# Altium schematic sheet PCB-MAIN_03_AUDIO.SchDoc
size 594 x 420 mm
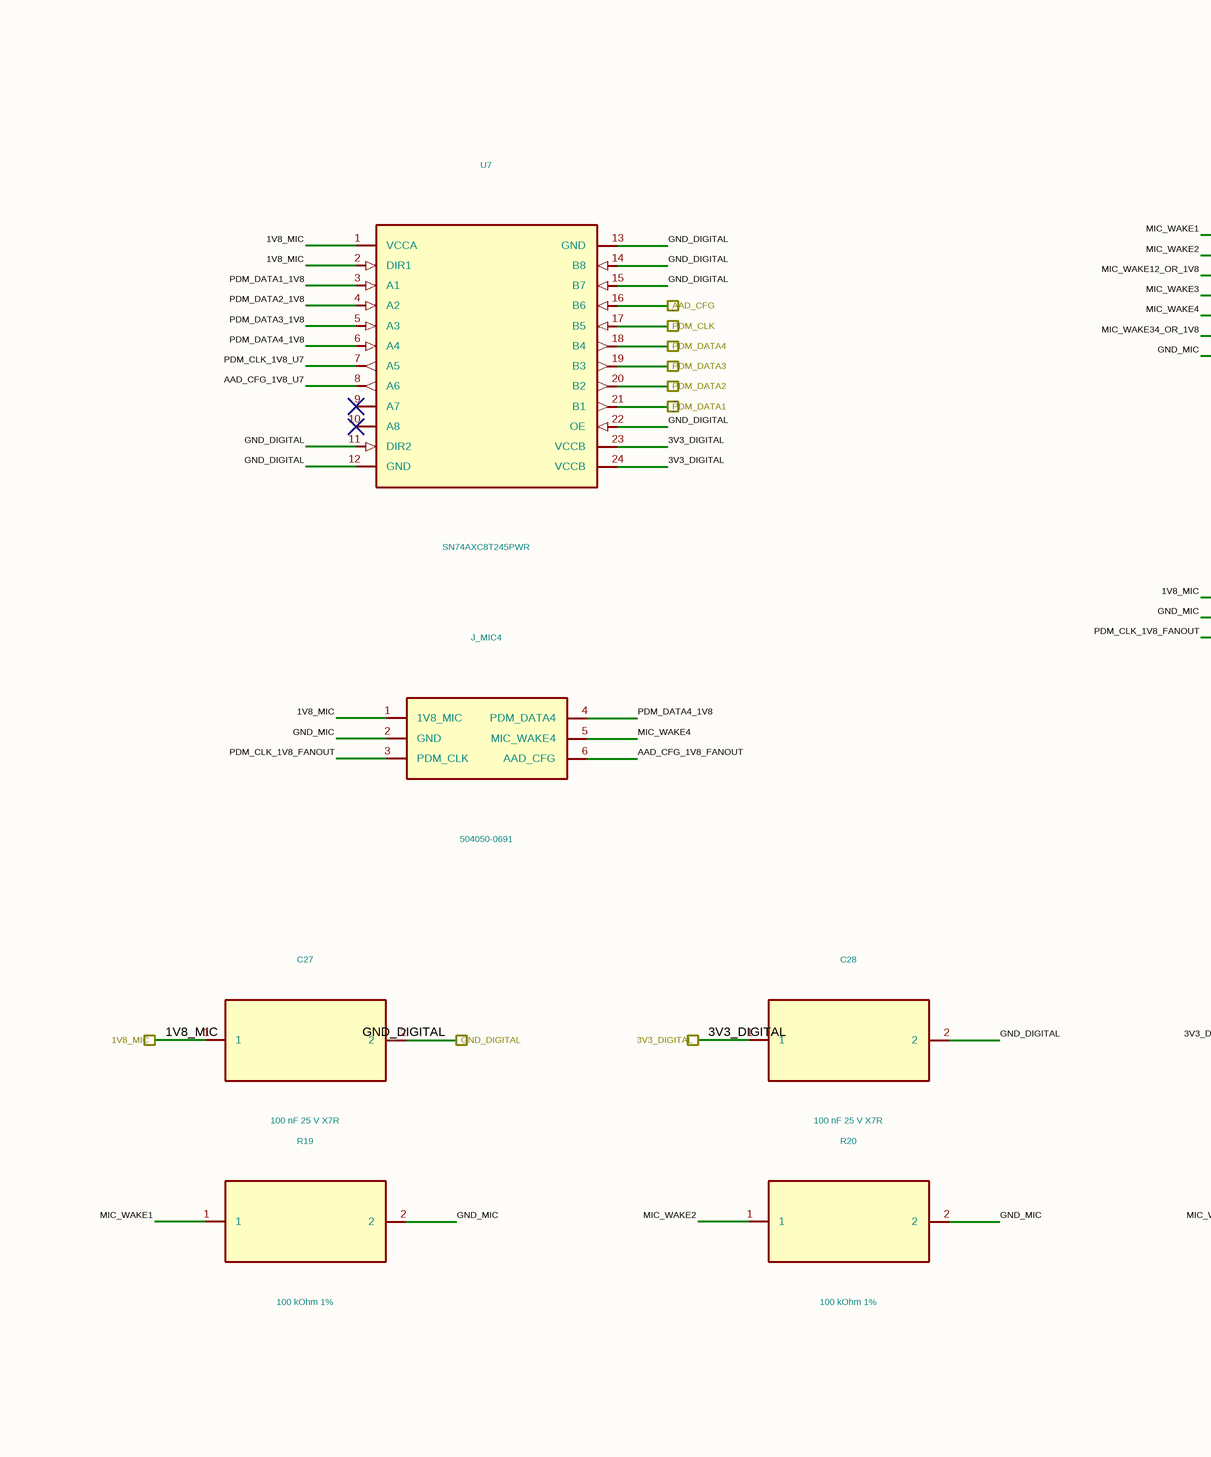
[diagram p0: PCB-MAIN_03_AUDIO.SchDoc, top left]
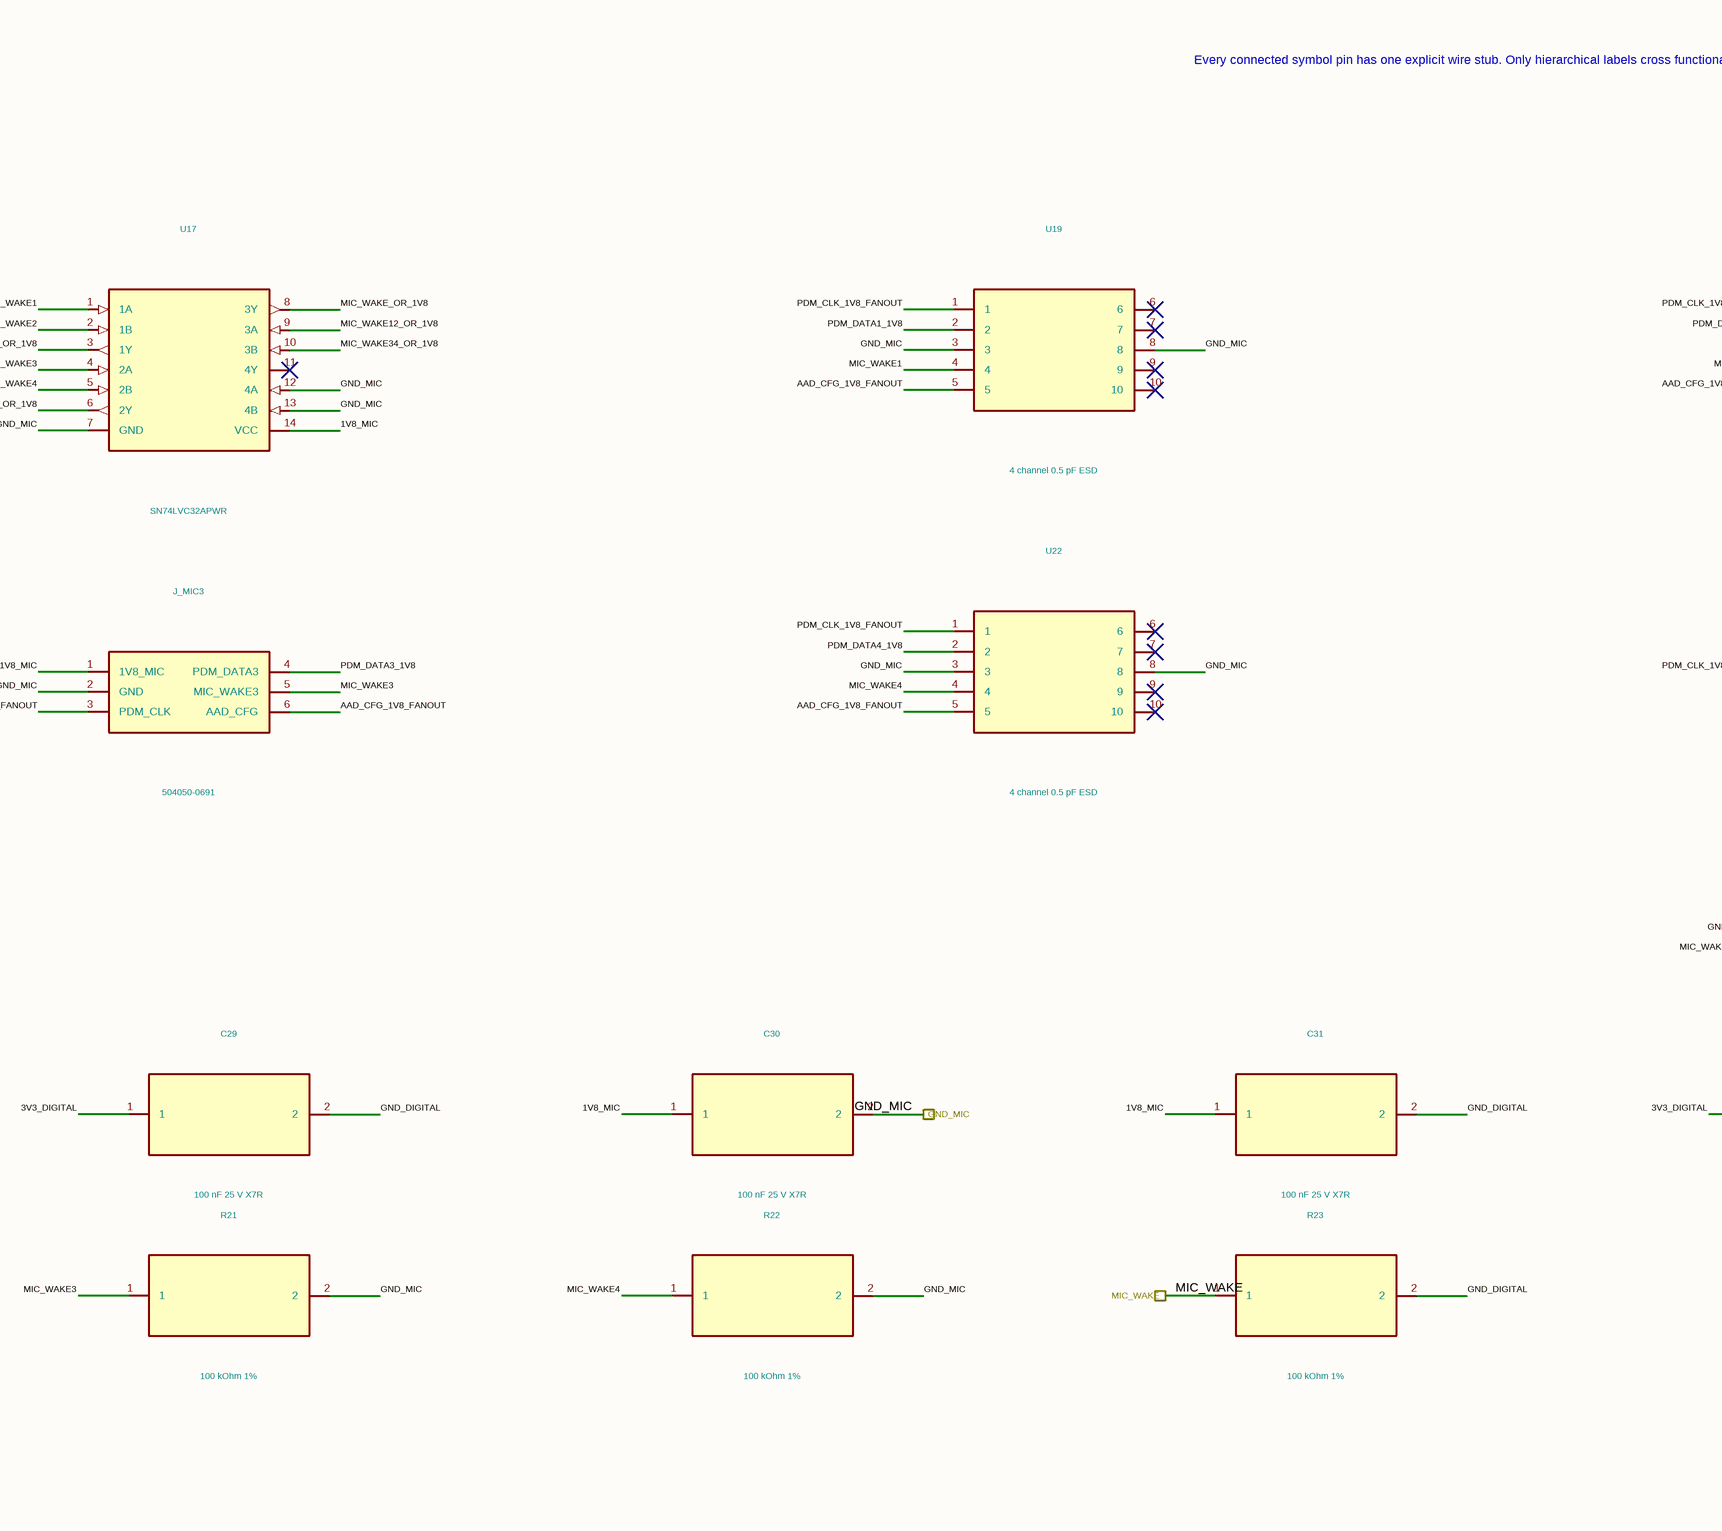
[diagram p1: PCB-MAIN_03_AUDIO.SchDoc, top middle]
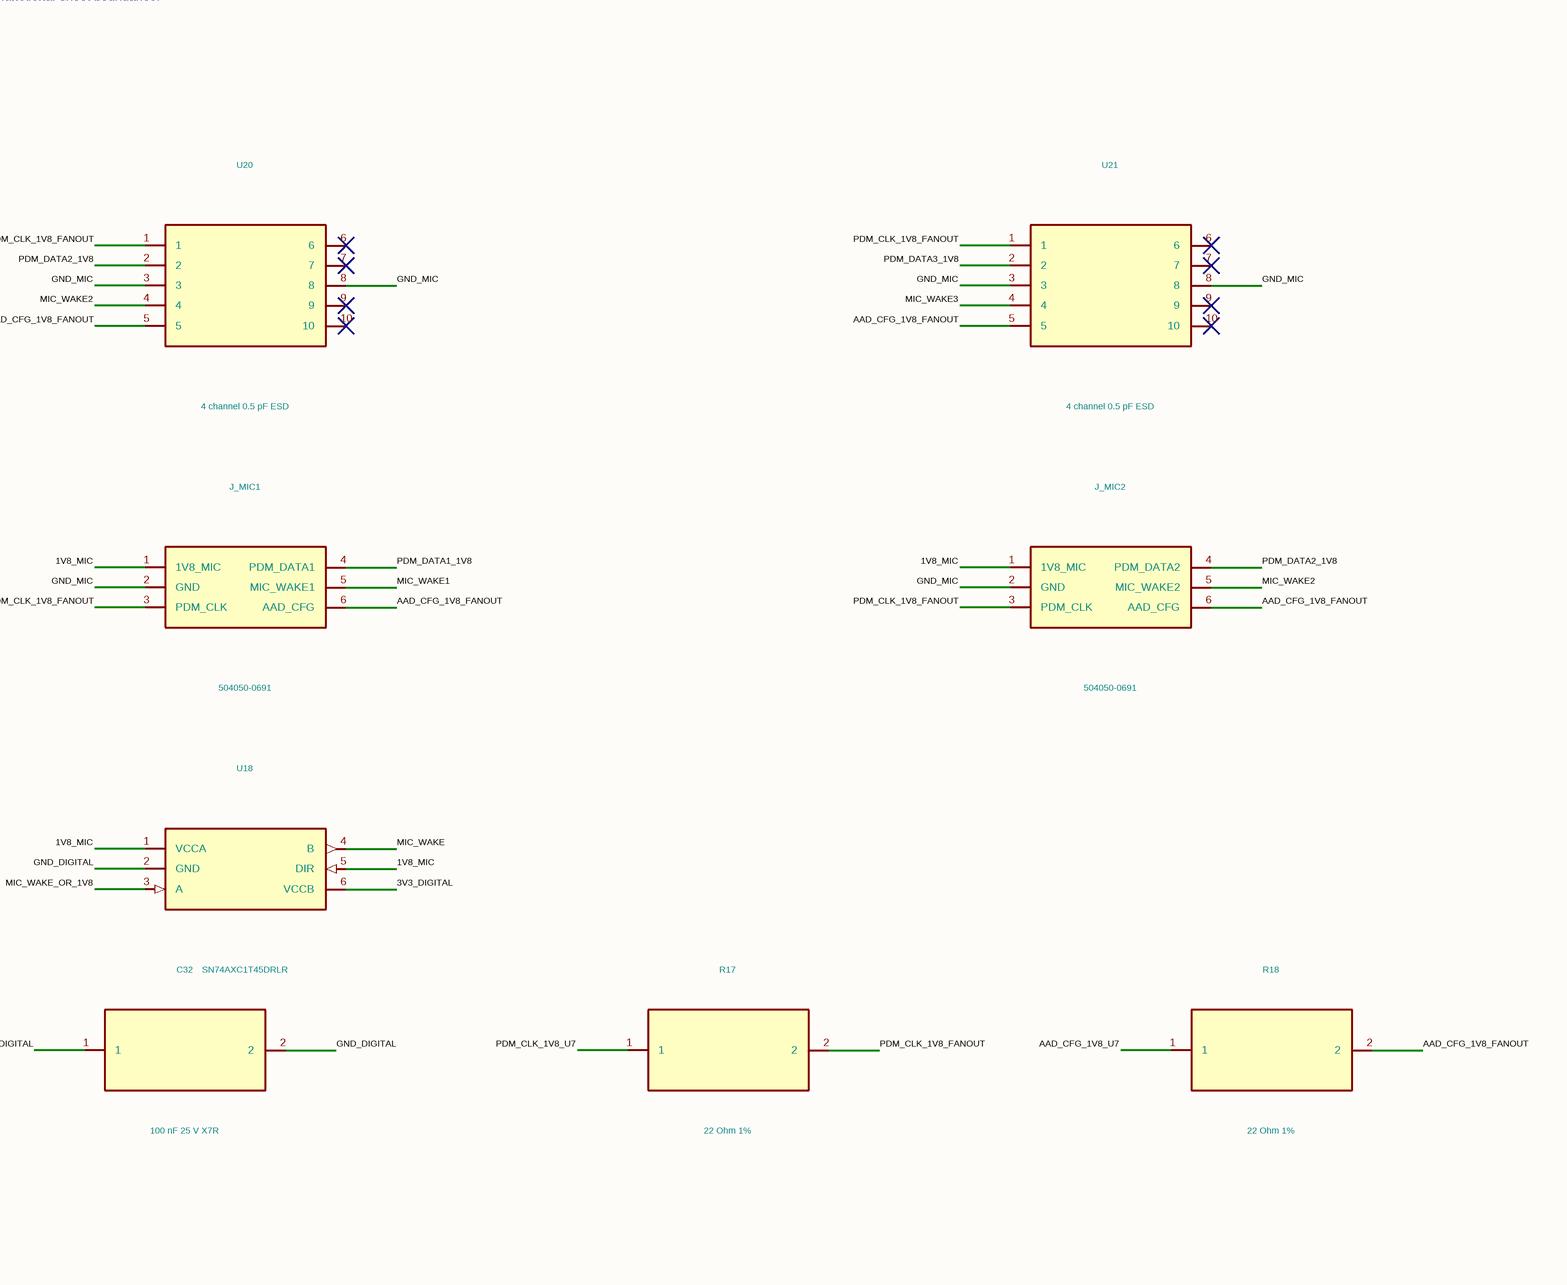
[diagram p2: PCB-MAIN_03_AUDIO.SchDoc, top right]
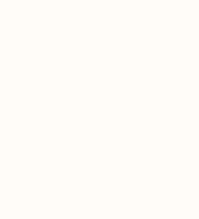
[diagram p3: PCB-MAIN_03_AUDIO.SchDoc, bottom left]

## Parts
C27  100 nF 25 V X7R  [C_0402_1005Metric]
C28  100 nF 25 V X7R  [C_0402_1005Metric]
C29  100 nF 25 V X7R  [C_0402_1005Metric]
C30  100 nF 25 V X7R  [C_0402_1005Metric]
C31  100 nF 25 V X7R  [C_0402_1005Metric]
C32  100 nF 25 V X7R  [C_0402_1005Metric]
J_MIC1  504050-0691
J_MIC2  504050-0691
J_MIC3  504050-0691
J_MIC4  504050-0691
R17  22 Ohm 1%  [R_0402_1005Metric]
R18  22 Ohm 1%  [R_0402_1005Metric]
R19  100 kOhm 1%  [R_0402_1005Metric]
R20  100 kOhm 1%  [R_0402_1005Metric]
R21  100 kOhm 1%  [R_0402_1005Metric]
R22  100 kOhm 1%  [R_0402_1005Metric]
R23  100 kOhm 1%  [R_0402_1005Metric]
U7  SN74AXC8T245PWR
U17  SN74LVC32APWR
U18  SN74AXC1T45DRLR
U19  4 channel 0.5 pF ESD
U20  4 channel 0.5 pF ESD
U21  4 channel 0.5 pF ESD
U22  4 channel 0.5 pF ESD

## Ports
1V8_MIC, 3V3_DIGITAL, AAD_CFG, GND_DIGITAL, GND_MIC, MIC_WAKE, PDM_CLK, PDM_DATA1, PDM_DATA2, PDM_DATA3, PDM_DATA4

## Nets
1V8_MIC: C27.1 C30.1 C31.1 J_MIC1.1(1V8_MIC) J_MIC2.1(1V8_MIC) J_MIC3.1(1V8_MIC) J_MIC4.1(1V8_MIC) U7.1(VCCA) U7.2(DIR1) U17.14(VCC) U18.1(VCCA) U18.5(DIR) ; port 1V8_MIC
3V3_DIGITAL: C28.1 C29.1 C32.1 U7.23(VCCB) U7.24(VCCB) U18.6(VCCB) ; port 3V3_DIGITAL
AAD_CFG: U7.16(B6) ; port AAD_CFG
AAD_CFG_1V8_FANOUT: J_MIC1.6(AAD_CFG) J_MIC2.6(AAD_CFG) J_MIC3.6(AAD_CFG) J_MIC4.6(AAD_CFG) R18.2 U19.5 U20.5 U21.5 U22.5
AAD_CFG_1V8_U7: R18.1 U7.8(A6)
GND_DIGITAL: C27.2 C28.2 C29.2 C31.2 C32.2 R23.2 U7.11(DIR2) U7.12(GND) U7.13(GND) U7.14(B8) U7.15(B7) U7.22(OE) U18.2(GND) ; port GND_DIGITAL
GND_MIC: C30.2 J_MIC1.2(GND) J_MIC2.2(GND) J_MIC3.2(GND) J_MIC4.2(GND) R19.2 R20.2 R21.2 R22.2 U17.7(GND) U17.12(4A) U17.13(4B) U19.3 U19.8 U20.3 U20.8 U21.3 U21.8 U22.3 U22.8 ; port GND_MIC
MIC_WAKE: R23.1 U18.4(B) ; port MIC_WAKE
MIC_WAKE1: J_MIC1.5(MIC_WAKE1) R19.1 U17.1(1A) U19.4
MIC_WAKE2: J_MIC2.5(MIC_WAKE2) R20.1 U17.2(1B) U20.4
MIC_WAKE3: J_MIC3.5(MIC_WAKE3) R21.1 U17.4(2A) U21.4
MIC_WAKE4: J_MIC4.5(MIC_WAKE4) R22.1 U17.5(2B) U22.4
MIC_WAKE12_OR_1V8: U17.3(1Y) U17.9(3A)
MIC_WAKE34_OR_1V8: U17.6(2Y) U17.10(3B)
MIC_WAKE_OR_1V8: U17.8(3Y) U18.3(A)
PDM_CLK: U7.17(B5) ; port PDM_CLK
PDM_CLK_1V8_FANOUT: J_MIC1.3(PDM_CLK) J_MIC2.3(PDM_CLK) J_MIC3.3(PDM_CLK) J_MIC4.3(PDM_CLK) R17.2 U19.1 U20.1 U21.1 U22.1
PDM_CLK_1V8_U7: R17.1 U7.7(A5)
PDM_DATA1: U7.21(B1) ; port PDM_DATA1
PDM_DATA1_1V8: J_MIC1.4(PDM_DATA1) U7.3(A1) U19.2
PDM_DATA2: U7.20(B2) ; port PDM_DATA2
PDM_DATA2_1V8: J_MIC2.4(PDM_DATA2) U7.4(A2) U20.2
PDM_DATA3: U7.19(B3) ; port PDM_DATA3
PDM_DATA3_1V8: J_MIC3.4(PDM_DATA3) U7.5(A3) U21.2
PDM_DATA4: U7.18(B4) ; port PDM_DATA4
PDM_DATA4_1V8: J_MIC4.4(PDM_DATA4) U7.6(A4) U22.2

Not connected (* = marked no-connect by the designer): U7 9(A7)* 10(A8)*; U17 11(4Y)*; U19 6* 7* 9* 10*; U20 6* 7* 9* 10*; U21 6* 7* 9* 10*; U22 6* 7* 9* 10*

## Notes on the sheet
- Every connected symbol pin has one explicit wire stub. Only hierarchical labels cross functional-sheet boundaries.
- 1
- 2
- 3
- 4
- 5
- 6
- 7
- 8
- 9
- 10
- 11
- A
- B
- C
- D
- E
- F
- G
- H
- Human-readable hierarchy candidate; exact Review-A pin/net equivalence enforced
- Functional sheet 4 of 10
- NOT FOR MANUFACTURE - hierarchy review/routing/DRC/DFM/Review B pending
- Title: Dioneya PCB-MAIN Rev.A - PDM audio
- File: PCB-MAIN_03_AUDIO.kicad_sch
- Sheet: /
- Dioneya / ZS-BPLA
- KiCad E.D.A.  kicad (5.1.4)-1
- Size: A2
- Date: 2026-09-16
- Rev: A
- Id: 1/1

## Library data of the parts
C27 = C27_GRM155R71E104KE14D: Manufacturer: Murata; Population: FITTED; Authority: TI_SCES875C_RevC; MPN: GRM155R71E104KE14D; Package: 0402; Value: 100 nF 25 V X7R; Footprint: Capacitor_SMD:C_0402_1005Metric
C28 = C28_GRM155R71E104KE14D: Manufacturer: Murata; Population: FITTED; Authority: TI_SCES875C_RevC; MPN: GRM155R71E104KE14D; Package: 0402; Value: 100 nF 25 V X7R; Footprint: Capacitor_SMD:C_0402_1005Metric
C29 = C29_GRM155R71E104KE14D: Manufacturer: Murata; Population: FITTED; Authority: TI_SCES875C_RevC; MPN: GRM155R71E104KE14D; Package: 0402; Value: 100 nF 25 V X7R; Footprint: Capacitor_SMD:C_0402_1005Metric
C30 = C30_GRM155R71E104KE14D: Manufacturer: Murata; Population: FITTED; Authority: TI_SCAS286U_RevU; MPN: GRM155R71E104KE14D; Package: 0402; Value: 100 nF 25 V X7R; Footprint: Capacitor_SMD:C_0402_1005Metric
C31 = C31_GRM155R71E104KE14D: Manufacturer: Murata; Population: FITTED; Authority: TI_SCES882E_RevE; MPN: GRM155R71E104KE14D; Package: 0402; Value: 100 nF 25 V X7R; Footprint: Capacitor_SMD:C_0402_1005Metric
C32 = C32_GRM155R71E104KE14D: Manufacturer: Murata; Population: FITTED; Authority: TI_SCES882E_RevE; MPN: GRM155R71E104KE14D; Package: 0402; Value: 100 nF 25 V X7R; Footprint: Capacitor_SMD:C_0402_1005Metric
J_MIC1 = J_MIC1_504050-0691: Manufacturer: Molex; Population: FITTED; Authority: HARNESS_LOGICAL_PINOUT_REV_A.csv; MPN: 504050-0691; Package: Pico-Lock_1.5_1x06_Right_Angle; Value: 504050-0691
J_MIC2 = J_MIC2_504050-0691: Manufacturer: Molex; Population: FITTED; Authority: HARNESS_LOGICAL_PINOUT_REV_A.csv; MPN: 504050-0691; Package: Pico-Lock_1.5_1x06_Right_Angle; Value: 504050-0691
J_MIC3 = J_MIC3_504050-0691: Manufacturer: Molex; Population: FITTED; Authority: HARNESS_LOGICAL_PINOUT_REV_A.csv; MPN: 504050-0691; Package: Pico-Lock_1.5_1x06_Right_Angle; Value: 504050-0691
J_MIC4 = J_MIC4_504050-0691: Manufacturer: Molex; Population: FITTED; Authority: HARNESS_LOGICAL_PINOUT_REV_A.csv; MPN: 504050-0691; Package: Pico-Lock_1.5_1x06_Right_Angle; Value: 504050-0691
R17 = R17_ERJ-2RKF22R0X: Manufacturer: Panasonic; Population: FITTED; Authority: PROJECT_MAIN_AUTH_010; MPN: ERJ-2RKF22R0X; Package: 0402; Value: 22 Ohm 1%; Footprint: Resistor_SMD:R_0402_1005Metric
R18 = R18_ERJ-2RKF22R0X: Manufacturer: Panasonic; Population: FITTED; Authority: PROJECT_MAIN_AUTH_010; MPN: ERJ-2RKF22R0X; Package: 0402; Value: 22 Ohm 1%; Footprint: Resistor_SMD:R_0402_1005Metric
R19 = R19_ERJ-2RKF1003X: Manufacturer: Panasonic; Population: FITTED; Authority: TDK_T5838_DS-000383_Rev1.2; MPN: ERJ-2RKF1003X; Package: 0402; Value: 100 kOhm 1%; Footprint: Resistor_SMD:R_0402_1005Metric
R20 = R20_ERJ-2RKF1003X: Manufacturer: Panasonic; Population: FITTED; Authority: TDK_T5838_DS-000383_Rev1.2; MPN: ERJ-2RKF1003X; Package: 0402; Value: 100 kOhm 1%; Footprint: Resistor_SMD:R_0402_1005Metric
R21 = R21_ERJ-2RKF1003X: Manufacturer: Panasonic; Population: FITTED; Authority: TDK_T5838_DS-000383_Rev1.2; MPN: ERJ-2RKF1003X; Package: 0402; Value: 100 kOhm 1%; Footprint: Resistor_SMD:R_0402_1005Metric
R22 = R22_ERJ-2RKF1003X: Manufacturer: Panasonic; Population: FITTED; Authority: TDK_T5838_DS-000383_Rev1.2; MPN: ERJ-2RKF1003X; Package: 0402; Value: 100 kOhm 1%; Footprint: Resistor_SMD:R_0402_1005Metric
R23 = R23_ERJ-2RKF1003X: Manufacturer: Panasonic; Population: FITTED; Authority: TI_SCES882E_RevE; MPN: ERJ-2RKF1003X; Package: 0402; Value: 100 kOhm 1%; Footprint: Resistor_SMD:R_0402_1005Metric
U7 = U7_SN74AXC8T245PWR: Manufacturer: Texas Instruments; Population: FITTED; Authority: PCB_MAIN_AUDIO_LOGIC_PIN_AUTHORITY_REV_A.csv; MPN: SN74AXC8T245PWR; Package: TSSOP-24_PW; Value: SN74AXC8T245PWR
U17 = U17_SN74LVC32APWR: Manufacturer: Texas Instruments; Population: FITTED; Authority: PCB_MAIN_AUDIO_LOGIC_PIN_AUTHORITY_REV_A.csv; MPN: SN74LVC32APWR; Package: TSSOP-14_PW; Value: SN74LVC32APWR
U18 = U18_SN74AXC1T45DRLR: Manufacturer: Texas Instruments; Population: FITTED; Authority: PCB_MAIN_AUDIO_LOGIC_PIN_AUTHORITY_REV_A.csv; MPN: SN74AXC1T45DRLR; Package: SOT-5X3-6_DRL; Value: SN74AXC1T45DRLR
U19 = U19_TPD4E05U06DQAR: Manufacturer: Texas Instruments; Population: FITTED; Authority: TI_TPDxE05U06_RevO; MPN: TPD4E05U06DQAR; Package: USON-10_DQA; Value: 4 channel 0.5 pF ESD
U20 = U20_TPD4E05U06DQAR: Manufacturer: Texas Instruments; Population: FITTED; Authority: TI_TPDxE05U06_RevO; MPN: TPD4E05U06DQAR; Package: USON-10_DQA; Value: 4 channel 0.5 pF ESD
U21 = U21_TPD4E05U06DQAR: Manufacturer: Texas Instruments; Population: FITTED; Authority: TI_TPDxE05U06_RevO; MPN: TPD4E05U06DQAR; Package: USON-10_DQA; Value: 4 channel 0.5 pF ESD
U22 = U22_TPD4E05U06DQAR: Manufacturer: Texas Instruments; Population: FITTED; Authority: TI_TPDxE05U06_RevO; MPN: TPD4E05U06DQAR; Package: USON-10_DQA; Value: 4 channel 0.5 pF ESD